# Altium schematic sheet SMPS_Section.SchDoc (part 2 of 2)
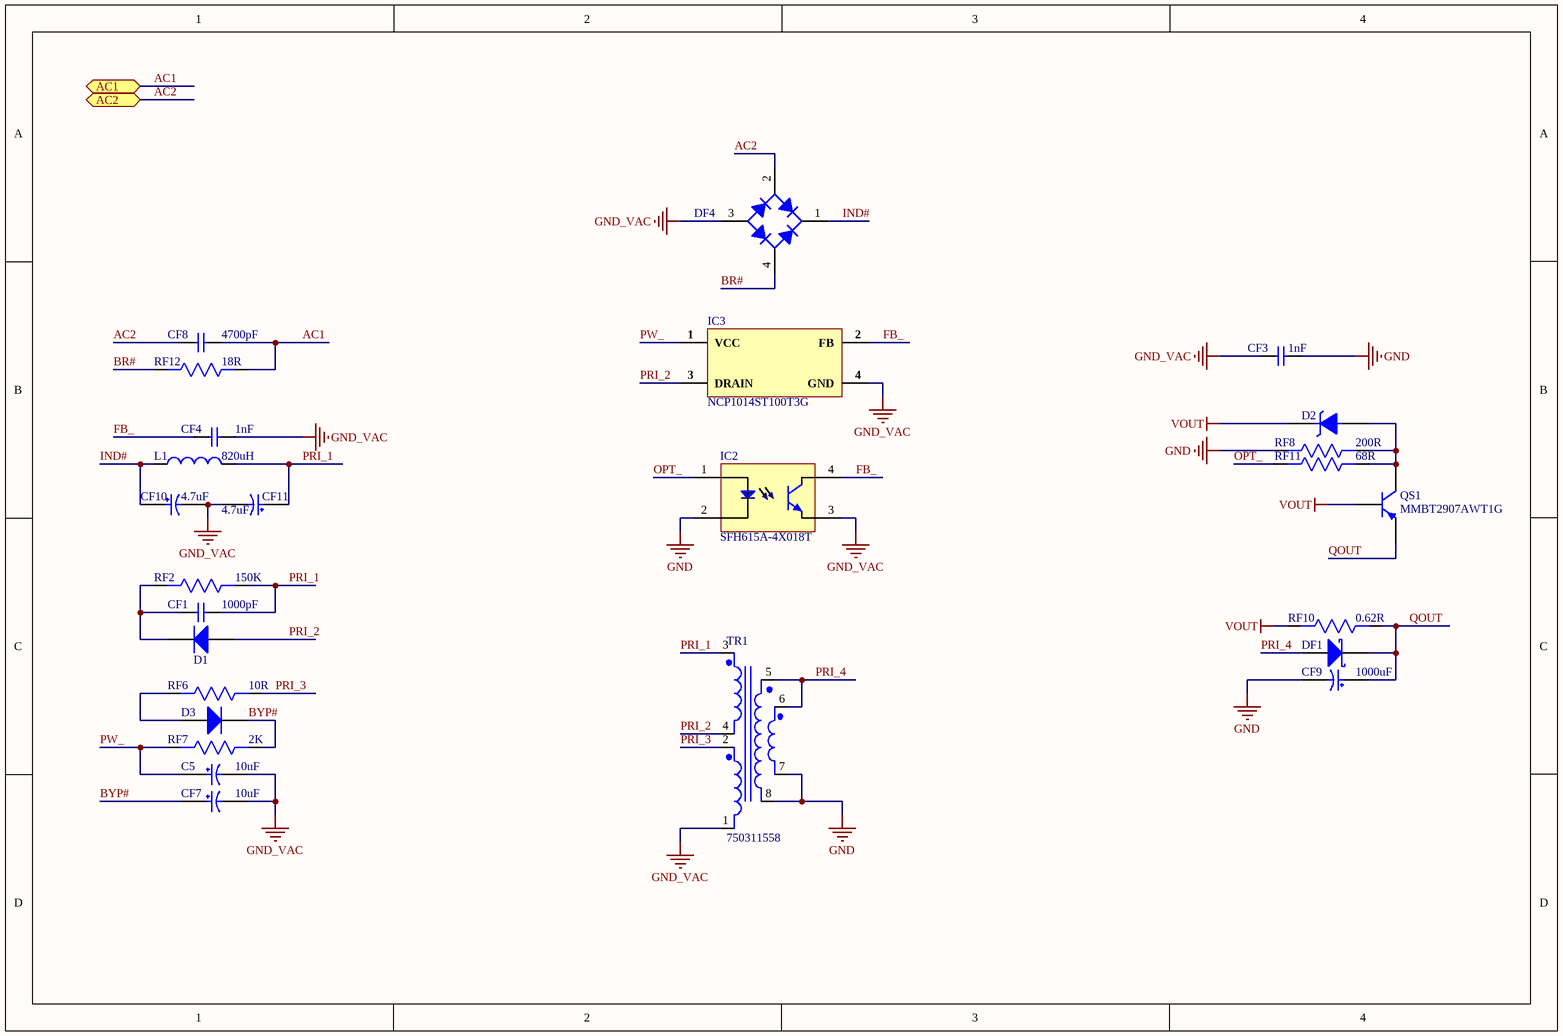
[diagram p1: SMPS_Section.SchDoc]

## Library data of the parts
C5 CF7 = EEE-1EA100WR: CAP ALUM 10UF 20% 25V SMD; Manufacturer: Panasonic; Ripple Current: 22mA; Polarity: Polar; Life (Hours): 2000Hour; Supplier 1: Digi-Key; Manufacturer Part Number: EEE-1EA100WR; RoHS: Yes; Category: Aluminum Electrolytic Capacitors; Stock 1: 20392; Pricing 1: 1=0.29000, 10=0.19700, 50=0.13160, 100=0.11190, 500=0.07896, 1000=0.06909 (USD); Mount: Surface Mount,PCB; Case/Package: Radial; Contact Plating: Tin; Min Operating Temperature: -40°C; Max Operating Temperature: 85°C; Capacitance: 10uF; Tolerance: 20%; Termination: SMD/SMT; Voltage Rating: 25V; Packaging: Tape and Reel; Package Quantity: 1; Voltage Rating (DC): 25V; Ripple Current (AC): 22mA; Diameter: 4mm; Length: 5.5mm; Height: 5.4mm; Height - Seated (Max): 0.213inch; Radiation Hardening: No; Lead Free: Lead Free; REACH SVHC: Unknown; ComponentLink1URL: https://datasheet.ciiva.com/2985/aba0000ce2-2985106.pdf?src-supplier=Avnet; ComponentLink1Description: https://datasheet.ciiva.com/2985/aba0000ce2-2985106.pdf?src-supplier=Avnet; ComponentLink2URL: https://datasheet.ciiva.com/17536/aba0000ce2-17536886.pdf?src-supplier=Avnet+Europe; ComponentLink2Description: https://datasheet.ciiva.com/17536/aba0000ce2-17536886.pdf?src-supplier=Avnet+Europe; ComponentLink3URL: https://datasheet.ciiva.com/16201/aba0000ce2-16201870.pdf?src-supplier=Future+Electronics; ComponentLink3Description: https://datasheet.ciiva.com/16201/aba0000ce2-16201870.pdf?src-supplier=Future+Electronics; Supplier Part Number 1: PCE3895CT-ND
CF1 = C0603W102KDRACAUTO: CAP CER 1000PF 1KV X7R 0603; Manufacturer: KEMET; Supplier 1: Digi-Key; Manufacturer Part Number: C0603W102KDRACAUTO; RoHS: No; Category: Ceramic Capacitors; Stock 1: 2355; Pricing 1: 1=0.49000, 10=0.34600, 50=0.26180, 100=0.22790, 500=0.16884, 1000=0.14351 (USD); Supplier Part Number 1: 399-C0603W102KDRACAUTOCT-ND
CF3 = MPX12W1100FA00MSSD: CAP FILM 1000PF 20% 300VAC RAD; Manufacturer: WIMA; Lead Diameter: 0.6mm; Supplier 1: Digi-Key; Manufacturer Part Number: MPX12W1100FA00MSSD; RoHS: Yes; Category: Uncategorized; Stock 1: 964; Pricing 1: 1=0.74000, 10=0.54300, 100=0.37250, 500=0.29488, 1000=0.24832, 2500=0.23280, 5000=0.21728 (USD); Case/Package: Radial; Min Operating Temperature: -40°C; Max Operating Temperature: 110°C; Capacitance: 1nF; Packaging: Bulk; Tolerance: 20%; Length: 13.5mm; Lead Pitch: 10mm; Depth: 4mm; Radiation Hardening: No; ComponentLink1URL: https://datasheet.ciiva.com/15164/getdatasheetpartid-658504-15164312.pdf?src-supplier=Verical; ComponentLink1Description: https://datasheet.ciiva.com/15164/getdatasheetpartid-658504-15164312.pdf?src-supplier=Verical; Supplier Part Number 1: 1928-1798-ND
CF4 = GRM155R72A102KA01D: CAP CER 1000PF 100V X7R 0402; Manufacturer: Murata; Tolerance: 10%; Supplier 1: Digi-Key; Manufacturer Part Number: GRM155R72A102KA01D; RoHS: Yes; Category: Ceramic Capacitors; Stock 1: 565854; Pricing 1: 1=0.10000, 10=0.04700, 50=0.02540, 100=0.02080, 500=0.01486, 1000=0.01168, 2500=0.01062, 5000=0.00977 (USD); Mount: Surface Mount; Case/Package: 0402; Case Code (Metric): 1005; Case Code (Imperial): 0402; Material: Ceramic; Min Operating Temperature: -55°C; Max Operating Temperature: 125°C; Capacitance: 1nF; Dielectric: X7R; Voltage Rating: 100V; Packaging: Tape and Reel; Package Quantity: 10000; Voltage Rating (DC): 100V; Termination: SMD/SMT; Voltage: 100V; Length: 1mm; Height: 0.5mm; Width: 0.5mm; Thickness: 0.022inch; Depth: 0.5mm; Radiation Hardening: No; REACH SVHC: No SVHC; Lead Free: Lead Free; ComponentLink1URL: https://datasheet.ciiva.com/18184/getdatasheetpartid-223878-18184773.pdf?src-supplier=Verical; ComponentLink1Description: https://datasheet.ciiva.com/18184/getdatasheetpartid-223878-18184773.pdf?src-supplier=Verical; ComponentLink2URL: https://datasheet.ciiva.com/11621/product-11621687.pdf?src-supplier=Avnet; ComponentLink2Description: https://datasheet.ciiva.com/11621/product-11621687.pdf?src-supplier=Avnet; ComponentLink3URL: https://datasheet.ciiva.com/6270/partnumbering-e-01-6270792.pdf?src-supplier=Digi-Key; ComponentLink3Description: https://datasheet.ciiva.com/6270/partnumbering-e-01-6270792.pdf?src-supplier=Digi-Key; ComponentLink4URL: https://datasheet.ciiva.com/6270/partnumbering-e-01-6270796.pdf?src-supplier=Digi-Key; ComponentLink4Description: https://datasheet.ciiva.com/6270/partnumbering-e-01-6270796.pdf?src-supplier=Digi-Key; ComponentLink5URL: https://datasheet.ciiva.com/6270/partnumbering-e-01-6270798.pdf?src-supplier=Digi-Key; ComponentLink5Description: https://datasheet.ciiva.com/6270/partnumbering-e-01-6270798.pdf?src-supplier=Digi-Key; Supplier Part Number 1: 490-6366-1-ND
CF8 = GA355DR7GF472KW01L: CAP CER 4700PF 250VAC X7R 2220; Manufacturer: Murata; Capacitance: 4.7nF; Tolerance: 10%; Voltage Rating: 250V; Supplier 1: Digi-Key; Manufacturer Part Number: GA355DR7GF472KW01L; RoHS: Yes; Category: Ceramic Capacitors; Stock 1: 46734; Pricing 1: 1=1.49000, 10=1.17500, 50=1.01800, 100=0.88090, 500=0.66556 (USD); Mount: Surface Mount; Case/Package: 2220; Number of Pins: 2; Case Code (Imperial): 2220; Case Code (Metric): 5750; Min Operating Temperature: -55°C; Max Operating Temperature: 125°C; Dielectric: X7R; Packaging: Tape and Reel; Package Quantity: 1; Termination: SMD/SMT; Voltage: 250V; Voltage Rating (DC): 250V; Voltage Rating (AC): 250V; Length: 5.7mm; Height: 2mm; Depth: 5mm; Width: 0.197inch; Thickness: 0.079inch; Radiation Hardening: No; REACH SVHC: No SVHC; Lead Free: Lead Free; ComponentLink1URL: https://datasheet.ciiva.com/11787/0900766b80936815-11787945.pdf?src-supplier=RSComponents; ComponentLink1Description: https://datasheet.ciiva.com/11787/0900766b80936815-11787945.pdf?src-supplier=RSComponents; ComponentLink2URL: https://datasheet.ciiva.com/18183/getdatasheetpartid-104333-18183450.pdf?src-supplier=Verical; ComponentLink2Description: https://datasheet.ciiva.com/18183/getdatasheetpartid-104333-18183450.pdf?src-supplier=Verical; ComponentLink3URL: https://datasheet.ciiva.com/142/partnumbering-e-01-142630.pdf?src-supplier=Digi-Key; ComponentLink3Description: https://datasheet.ciiva.com/142/partnumbering-e-01-142630.pdf?src-supplier=Digi-Key; ComponentLink4URL: https://datasheet.ciiva.com/142/partnumbering-e-01-142631.pdf?src-supplier=Digi-Key; ComponentLink4Description: https://datasheet.ciiva.com/142/partnumbering-e-01-142631.pdf?src-supplier=Digi-Key; ComponentLink5URL: https://datasheet.ciiva.com/142/partnumbering-e-01-142632.pdf?src-supplier=Digi-Key; ComponentLink5Description: https://datasheet.ciiva.com/142/partnumbering-e-01-142632.pdf?src-supplier=Digi-Key; ComponentLink6URL: https://datasheet.ciiva.com/22698/1889704-22698361.pdf?src-supplier=Element14; ComponentLink6Description: https://datasheet.ciiva.com/22698/1889704-22698361.pdf?src-supplier=Element14; ComponentLink7URL: https://datasheet.ciiva.com/41649/1506175-41649338.pdf?src-supplier=Farnell; ComponentLink7Description: https://datasheet.ciiva.com/41649/1506175-41649338.pdf?src-supplier=Farnell; ComponentLink8URL: https://datasheet.ciiva.com/7937/c02e-7937503.pdf?src-supplier=Element14; ComponentLink8Description: https://datasheet.ciiva.com/7937/c02e-7937503.pdf?src-supplier=Element14; ComponentLink9URL: https://datasheet.ciiva.com/14104/inga3-14104127.pdf?src-supplier=Distrelec; ComponentLink9Description: https://datasheet.ciiva.com/14104/inga3-14104127.pdf?src-supplier=Distrelec; Supplier Part Number 1: 490-3482-1-ND
CF9 = UWT0J102MNL1GS: CAP ALUM 1000UF 20% 6.3V SMD; Manufacturer: Nichicon; Dielectric Material: Aluminium; Capacitance: 1mF; Ripple Current: 230mA; Dissipation Factor: 0.3%; Leakage Current: 3uA; Life (Hours): 1000Hour; Lead Diameter: 1.1mm; Supplier 1: Digi-Key; Manufacturer Part Number: UWT0J102MNL1GS; RoHS: Yes; Category: Aluminum Electrolytic Capacitors; Stock 1: 46922; Pricing 1: 1=0.45000, 10=0.31900, 50=0.24140, 100=0.21020 (USD); Mount: Surface Mount; Case/Package: Radial; Number of Pins: 2; Min Operating Temperature: -55°C; Max Operating Temperature: 105°C; Tolerance: 20%; Termination: SMD/SMT; Voltage: 6.3V; Voltage Rating: 6.3V; Packaging: Tape and Reel; Ripple Current (AC): 230mA; Package Quantity: 500; Voltage Rating (DC): 6.3V; Features: General Purpose; Diameter: 8mm; Length: 10mm; Height: 10mm; Height - Seated (Max): 0.315inch; Lead Pitch: 3.1mm; Radiation Hardening: No; REACH SVHC: No SVHC; Lead Free: Lead Free; ComponentLink1URL: https://datasheet.ciiva.com/11776/0900766b80fa3a91-11776932.pdf?src-supplier=RSComponents; ComponentLink1Description: https://datasheet.ciiva.com/11776/0900766b80fa3a91-11776932.pdf?src-supplier=RSComponents; ComponentLink2URL: https://datasheet.ciiva.com/112/e-wt-112355.pdf?src-supplier=Digi-Key; ComponentLink2Description: https://datasheet.ciiva.com/112/e-wt-112355.pdf?src-supplier=Digi-Key; ComponentLink3URL: https://datasheet.ciiva.com/112/e-wt-112356.pdf?src-supplier=Digi-Key; ComponentLink3Description: https://datasheet.ciiva.com/112/e-wt-112356.pdf?src-supplier=Digi-Key; ComponentLink4URL: https://datasheet.ciiva.com/112/e-wt-112357.pdf?src-supplier=Digi-Key; ComponentLink4Description: https://datasheet.ciiva.com/112/e-wt-112357.pdf?src-supplier=Digi-Key; ComponentLink5URL: https://datasheet.ciiva.com/16502/e-wt-16502949.pdf?src-supplier=Future+Electronics; ComponentLink5Description: https://datasheet.ciiva.com/16502/e-wt-16502949.pdf?src-supplier=Future+Electronics; ComponentLink6URL: https://datasheet.ciiva.com/28458/1910938-28458373.pdf?src-supplier=Element14; ComponentLink6Description: https://datasheet.ciiva.com/28458/1910938-28458373.pdf?src-supplier=Element14; ComponentLink7URL: https://datasheet.ciiva.com/7793/e-wt-7793495.pdf?src-supplier=Element14; ComponentLink7Description: https://datasheet.ciiva.com/7793/e-wt-7793495.pdf?src-supplier=Element14; Supplier Part Number 1: 493-2160-1-ND
CF10 CF11 = ULR2G4R7MNL1GS: CAP ALUM 4.7UF 20% 400V SMD; Manufacturer: Nichicon; Ripple Current: 35mA; Leakage Current: 100uA; Life (Hours): 3000Hour; Dissipation Factor: 0.25%; Supplier 1: Digi-Key; Manufacturer Part Number: ULR2G4R7MNL1GS; RoHS: Yes; Category: Aluminum Electrolytic Capacitors; Stock 1: 108237; Pricing 1: 1=0.77000, 10=0.56900, 50=0.45540, 100=0.39030 (USD); Mount: Surface Mount; Case/Package: SMD/SMT; Min Operating Temperature: -40°C; Max Operating Temperature: 105°C; Voltage Rating (DC): 400V; Tolerance: 20%; Capacitance: 4.7uF; Packaging: Tape and Reel; Package Quantity: 500; Termination: SMD/SMT; Voltage Rating: 400V; Voltage: 400V; Diameter: 10mm; Length: 10mm; Height: 10mm; Height - Seated (Max): 0.433inch; Lead Pitch: 4.5mm; Lead Free: Lead Free; ComponentLink1URL: https://datasheet.ciiva.com/6317/e-lr-6317191.pdf?src-supplier=Digi-Key; ComponentLink1Description: https://datasheet.ciiva.com/6317/e-lr-6317191.pdf?src-supplier=Digi-Key; ComponentLink2URL: https://datasheet.ciiva.com/6317/e-lr-6317193.pdf?src-supplier=Digi-Key; ComponentLink2Description: https://datasheet.ciiva.com/6317/e-lr-6317193.pdf?src-supplier=Digi-Key; Supplier Part Number 1: 493-6709-1-ND
D1 = MURS160T3G: DIODE GEN PURP 600V 2A SMB; Manufacturer: ON Semiconductor; Max Surge Current: 35A; Recovery Time: 75ns; Forward Voltage: 1.25V; Max Reverse Current: 5uA; Average Rectified Current: 1A; Element Configuration: Single; Polarity: Standard; Supplier 1: Digi-Key; Manufacturer Part Number: MURS160T3G; RoHS: Yes; Category: Rectifier Diodes; Stock 1: 315219; Pricing 1: 1=0.41000, 10=0.27700, 100=0.16350, 500=0.11066, 1000=0.08803 (USD); Case/Package: SMB; Number of Pins: 2; Contact Plating: Tin,Matte; Min Operating Temperature: -65°C; Max Operating Temperature: 175°C; Package Quantity: 2500; Forward Current: 2A; Packaging: Tape and Reel; Reverse Recovery Time: 75ns; Max Repetitive Reverse Voltage (Vrrm): 600V; Max Forward Surge Current (Ifsm): 35A; Termination: SMD/SMT; Peak Non-Repetitive Surge Current: 35A; Voltage Rating (DC): 600V; Current Rating: 1A; Output Current: 1A; Max Reverse Voltage (DC): 600V; Reverse Voltage: 600V; Length: 4.32mm; Height: 2.13mm; Width: 3.56mm; Radiation Hardening: No; REACH SVHC: No SVHC; Lead Free: Lead Free; Halogen Free: Halogen Free; ComponentLink1URL: https://datasheet.ciiva.com/14169/tw601232-14169051.pdf?src-supplier=Distrelec; ComponentLink1Description: https://datasheet.ciiva.com/14169/tw601232-14169051.pdf?src-supplier=Distrelec; ComponentLink2URL: https://datasheet.ciiva.com/16470/murs120t3-d-16470453.pdf?src-supplier=Future+Electronics; ComponentLink2Description: https://datasheet.ciiva.com/16470/murs120t3-d-16470453.pdf?src-supplier=Future+Electronics; ComponentLink3URL: https://datasheet.ciiva.com/5763/murs120t3-d-5763111.pdf?src-supplier=Farnell; ComponentLink3Description: https://datasheet.ciiva.com/5763/murs120t3-d-5763111.pdf?src-supplier=Farnell; ComponentLink4URL: https://datasheet.ciiva.com/16474/murs120t3-d-16474392.pdf?src-supplier=Avnet+Asia; ComponentLink4Description: https://datasheet.ciiva.com/16474/murs120t3-d-16474392.pdf?src-supplier=Avnet+Asia; ComponentLink5URL: https://datasheet.ciiva.com/8294/murs120t3-d-8294553.pdf?src-supplier=Avnet; ComponentLink5Description: https://datasheet.ciiva.com/8294/murs120t3-d-8294553.pdf?src-supplier=Avnet; ComponentLink6URL: https://datasheet.ciiva.com/25950/murs120t3-d-25950042.pdf?src-supplier=Avnet+Europe; ComponentLink6Description: https://datasheet.ciiva.com/25950/murs120t3-d-25950042.pdf?src-supplier=Avnet+Europe; ComponentLink7URL: https://datasheet.ciiva.com/7962/murs120t3-d-7962876.pdf?src-supplier=Element14; ComponentLink7Description: https://datasheet.ciiva.com/7962/murs120t3-d-7962876.pdf?src-supplier=Element14; ComponentLink8URL: https://datasheet.ciiva.com/7962/murs120t3-d-7962877.pdf?src-supplier=Element14; ComponentLink8Description: https://datasheet.ciiva.com/7962/murs120t3-d-7962877.pdf?src-supplier=Element14; ComponentLink9URL: https://datasheet.ciiva.com/7962/murs120t3-d-7962878.pdf?src-supplier=Element14; ComponentLink9Description: https://datasheet.ciiva.com/7962/murs120t3-d-7962878.pdf?src-supplier=Element14; Supplier Part Number 1: MURS160T3GOSCT-ND
D2 = MMSZ5229BT1: DIODE ZENER 4.3V 500MW SOD123; Manufacturer: ON Semiconductor; Manufacturer Part Number: MMSZ5229BT1G; Material: Plastic; Tolerance: 5%; Impedance: 22R; Max Reverse Leakage Current: 5uA; Zener Current: 10mA; Test Current: 20mA; Element Configuration: Single; Forward Voltage: 900mV; ESD Protection: Yes; Supplier 1: Digi-Key; RoHS: Yes; Category: Zener Diodes; Stock 1: 9037; Pricing 1: 1=0.21000, 10=0.18400, 100=0.08670, 500=0.05146, 1000=0.03381 (USD); Case/Package: SOD-123-2; Number of Pins: 2; Contact Plating: Tin,Matte; Min Operating Temperature: -55°C; Max Operating Temperature: 150°C; Packaging: Tape and Reel; Max Power Dissipation: 500mW; Package Quantity: 1; Zener Voltage: 4.3V; Voltage Tolerance: 5%; Power Dissipation: 500mW; Voltage Rating (DC): 4.3V; Power Rating: 500mW; Working Voltage: 4.3V; Max Reverse Current: 5uA; Termination: SMD/SMT; Length: 2.69mm; Height: 1.12mm; Width: 1.6mm; Radiation Hardening: No; Lead Free: Lead Free; REACH SVHC: No SVHC; ComponentLink1URL: https://datasheet.ciiva.com/15142/getdatasheetpartid-88753-15142539.pdf?src-supplier=Verical; ComponentLink1Description: https://datasheet.ciiva.com/15142/getdatasheetpartid-88753-15142539.pdf?src-supplier=Verical; ComponentLink2URL: https://datasheet.ciiva.com/894/mmsz5221bt1-d-894935.pdf?src-supplier=Digi-Key; ComponentLink2Description: https://datasheet.ciiva.com/894/mmsz5221bt1-d-894935.pdf?src-supplier=Digi-Key; ComponentLink3URL: https://datasheet.ciiva.com/4731/mmsz5221bt1-d-4731591.pdf?src-supplier=Mouser; ComponentLink3Description: https://datasheet.ciiva.com/4731/mmsz5221bt1-d-4731591.pdf?src-supplier=Mouser; ComponentLink4URL: https://datasheet.ciiva.com/26093/mmsz5221bt1-d-26093031.pdf?src-supplier=Avnet+Europe; ComponentLink4Description: https://datasheet.ciiva.com/26093/mmsz5221bt1-d-26093031.pdf?src-supplier=Avnet+Europe; ComponentLink5URL: https://datasheet.ciiva.com/894/mmsz5221bt1-d-894936.pdf?src-supplier=Digi-Key; ComponentLink5Description: https://datasheet.ciiva.com/894/mmsz5221bt1-d-894936.pdf?src-supplier=Digi-Key; ComponentLink6URL: https://datasheet.ciiva.com/8346/mmsz5221bt1-d-8346200.pdf?src-supplier=Avnet; ComponentLink6Description: https://datasheet.ciiva.com/8346/mmsz5221bt1-d-8346200.pdf?src-supplier=Avnet; ComponentLink7URL: https://datasheet.ciiva.com/894/mmsz5221bt1-d-894937.pdf?src-supplier=Digi-Key; ComponentLink7Description: https://datasheet.ciiva.com/894/mmsz5221bt1-d-894937.pdf?src-supplier=Digi-Key; ComponentLink8URL: https://datasheet.ciiva.com/8348/mmsz5221bt1-d-8348107.pdf?src-supplier=Avnet; ComponentLink8Description: https://datasheet.ciiva.com/8348/mmsz5221bt1-d-8348107.pdf?src-supplier=Avnet; ComponentLink9URL: https://datasheet.ciiva.com/16463/mmsz5221bt1-d-16463245.pdf?src-supplier=Future+Electronics; ComponentLink9Description: https://datasheet.ciiva.com/16463/mmsz5221bt1-d-16463245.pdf?src-supplier=Future+Electronics; ComponentLink10URL: https://datasheet.ciiva.com/16473/mmsz5221bt1-d-16473405.pdf?src-supplier=Avnet+Asia; ComponentLink10Description: https://datasheet.ciiva.com/16473/mmsz5221bt1-d-16473405.pdf?src-supplier=Avnet+Asia; ComponentLink11URL: https://datasheet.ciiva.com/22697/86126-22697917.pdf?src-supplier=Element14; ComponentLink11Description: https://datasheet.ciiva.com/22697/86126-22697917.pdf?src-supplier=Element14; ComponentLink12URL: https://datasheet.ciiva.com/8026/86126-8026846.pdf?src-supplier=Element14; ComponentLink12Description: https://datasheet.ciiva.com/8026/86126-8026846.pdf?src-supplier=Element14; Supplier Part Number 1: MMSZ5229BT1GOSCT-ND
D3 = MMSD4148T1G: DIODE GEN PURP 100V 200MA SOD123; Manufacturer: ON Semiconductor; Reverse Recovery Time: 4ns; Peak Non-Repetitive Surge Current: 2A; Element Configuration: Single; Forward Voltage: 1V; Max Reverse Current: 5uA; Power Dissipation: 425mW; Polarity: Standard; Current Rating: 200A; Capacitance: 4pF; Supplier 1: Digi-Key; Manufacturer Part Number: MMSD4148T1G; RoHS: Yes; Category: Rectifier Diodes; Stock 1: 208512; Pricing 1: 1=0.13000, 10=0.11100, 100=0.04270, 500=0.03116, 1000=0.02092 (USD); Case/Package: SOD-123-2; Number of Pins: 2; Contact Plating: Tin,Matte; Min Operating Temperature: -55°C; Max Operating Temperature: 150°C; Forward Current: 200mA; Max Repetitive Reverse Voltage (Vrrm): 100V; Recovery Time: 4ns; Max Surge Current: 2A; Package Quantity: 1; Packaging: Tape and Reel; Average Rectified Current: 200mA; Max Reverse Voltage (DC): 100V; Max Reverse Leakage Current: 5uA; Max Forward Surge Current (Ifsm): 2A; Voltage Rating (DC): 100V; Output Current: 200mA; Length: 2.69mm; Height: 1.12mm; Width: 1.6mm; Radiation Hardening: No; Lead Free: Lead Free; Halogen Free: Halogen Free; REACH SVHC: No SVHC; ComponentLink1URL: https://datasheet.ciiva.com/22663/1707241-22663688.pdf?src-supplier=Element14; ComponentLink1Description: https://datasheet.ciiva.com/22663/1707241-22663688.pdf?src-supplier=Element14; ComponentLink2URL: https://datasheet.ciiva.com/8294/mmsd4148t1-d-8294902.pdf?src-supplier=Avnet; ComponentLink2Description: https://datasheet.ciiva.com/8294/mmsd4148t1-d-8294902.pdf?src-supplier=Avnet; ComponentLink3URL: https://datasheet.ciiva.com/915/mmsd4148t1-d-915383.pdf?src-supplier=Digi-Key; ComponentLink3Description: https://datasheet.ciiva.com/915/mmsd4148t1-d-915383.pdf?src-supplier=Digi-Key; ComponentLink4URL: https://datasheet.ciiva.com/16474/mmsd4148t1-d-16474311.pdf?src-supplier=Avnet+Asia; ComponentLink4Description: https://datasheet.ciiva.com/16474/mmsd4148t1-d-16474311.pdf?src-supplier=Avnet+Asia; ComponentLink5URL: https://datasheet.ciiva.com/915/mmsd4148t1-d-915384.pdf?src-supplier=Digi-Key; ComponentLink5Description: https://datasheet.ciiva.com/915/mmsd4148t1-d-915384.pdf?src-supplier=Digi-Key; ComponentLink6URL: https://datasheet.ciiva.com/915/mmsd4148t1-d-915385.pdf?src-supplier=Digi-Key; ComponentLink6Description: https://datasheet.ciiva.com/915/mmsd4148t1-d-915385.pdf?src-supplier=Digi-Key; ComponentLink7URL: https://datasheet.ciiva.com/16368/mmsd4148t1-d-16368570.pdf?src-supplier=Future+Electronics; ComponentLink7Description: https://datasheet.ciiva.com/16368/mmsd4148t1-d-16368570.pdf?src-supplier=Future+Electronics; ComponentLink8URL: https://datasheet.ciiva.com/8299/mmsd4148t1-d-8299883.pdf?src-supplier=Avnet; ComponentLink8Description: https://datasheet.ciiva.com/8299/mmsd4148t1-d-8299883.pdf?src-supplier=Avnet; ComponentLink9URL: https://datasheet.ciiva.com/25947/mmsd4148t1-d-25947947.pdf?src-supplier=Avnet+Europe; ComponentLink9Description: https://datasheet.ciiva.com/25947/mmsd4148t1-d-25947947.pdf?src-supplier=Avnet+Europe; ComponentLink10URL: https://datasheet.ciiva.com/8053/mmsd4148t1-d-8053692.pdf?src-supplier=Element14; ComponentLink10Description: https://datasheet.ciiva.com/8053/mmsd4148t1-d-8053692.pdf?src-supplier=Element14; ComponentLink11URL: https://datasheet.ciiva.com/8053/mmsd4148t1-d-8053693.pdf?src-supplier=Element14; ComponentLink11Description: https://datasheet.ciiva.com/8053/mmsd4148t1-d-8053693.pdf?src-supplier=Element14; ComponentLink12URL: https://datasheet.ciiva.com/15144/getdatasheetpartid-78734-15144509.pdf?src-supplier=Verical; ComponentLink12Description: https://datasheet.ciiva.com/15144/getdatasheetpartid-78734-15144509.pdf?src-supplier=Verical; Supplier Part Number 1: MMSD4148T1GOSCT-ND
DF1 = MBRS360T3G: DIODE SCHOTTKY 60V 3A SMC; Manufacturer: ON Semiconductor; Max Reverse Current: 150uA; Peak Non-Repetitive Surge Current: 125A; Element Configuration: Single; Forward Voltage: 740mV; Polarity: Standard; Supplier 1: Digi-Key; Manufacturer Part Number: MBRS360T3G; RoHS: Yes; Category: Schottky Diodes; Stock 1: 113534; Pricing 1: 1=0.47000, 10=0.34700, 100=0.24180, 500=0.15314, 1000=0.12493 (USD); Case/Package: SMC; Number of Pins: 2; Contact Plating: Tin,Matte; Min Operating Temperature: -65°C; Max Operating Temperature: 175°C; Forward Current: 3A; Max Repetitive Reverse Voltage (Vrrm): 60V; Package Quantity: 2500; Max Surge Current: 125A; Packaging: Tape and Reel; Max Reverse Leakage Current: 150uA; Average Rectified Current: 3A; Max Forward Surge Current (Ifsm): 125A; Termination: SMD/SMT; Voltage Rating (DC): 60V; Current Rating: 3A; Output Current: 3A; Max Reverse Voltage (DC): 60V; Length: 6.86mm; Height: 2.13mm; Width: 5.84mm; Radiation Hardening: No; REACH SVHC: No SVHC; Lead Free: Lead Free; Halogen Free: Halogen Free; ComponentLink1URL: https://datasheet.ciiva.com/34301/866314-34301618.pdf?src-supplier=Jameco; ComponentLink1Description: https://datasheet.ciiva.com/34301/866314-34301618.pdf?src-supplier=Jameco; ComponentLink2URL: https://datasheet.ciiva.com/25954/mbrs360t3-d-25954259.pdf?src-supplier=Avnet+Europe; ComponentLink2Description: https://datasheet.ciiva.com/25954/mbrs360t3-d-25954259.pdf?src-supplier=Avnet+Europe; ComponentLink3URL: https://datasheet.ciiva.com/26788/mbrs360t3g-26788572.pdf?src-supplier=IIIC; ComponentLink3Description: https://datasheet.ciiva.com/26788/mbrs360t3g-26788572.pdf?src-supplier=IIIC; ComponentLink4URL: https://datasheet.ciiva.com/916/mbrs360t3-d-916052.pdf?src-supplier=Digi-Key; ComponentLink4Description: https://datasheet.ciiva.com/916/mbrs360t3-d-916052.pdf?src-supplier=Digi-Key; ComponentLink5URL: https://datasheet.ciiva.com/916/mbrs360t3-d-916053.pdf?src-supplier=Digi-Key; ComponentLink5Description: https://datasheet.ciiva.com/916/mbrs360t3-d-916053.pdf?src-supplier=Digi-Key; ComponentLink6URL: https://datasheet.ciiva.com/916/mbrs360t3-d-916054.pdf?src-supplier=Digi-Key; ComponentLink6Description: https://datasheet.ciiva.com/916/mbrs360t3-d-916054.pdf?src-supplier=Digi-Key; ComponentLink7URL: https://datasheet.ciiva.com/8299/mbrs360t3-d-8299863.pdf?src-supplier=Avnet; ComponentLink7Description: https://datasheet.ciiva.com/8299/mbrs360t3-d-8299863.pdf?src-supplier=Avnet; ComponentLink8URL: https://datasheet.ciiva.com/28655/mbrs360t3-d-28655799.pdf?src-supplier=Element14; ComponentLink8Description: https://datasheet.ciiva.com/28655/mbrs360t3-d-28655799.pdf?src-supplier=Element14; ComponentLink9URL: https://datasheet.ciiva.com/22659/1806490-22659080.pdf?src-supplier=Element14; ComponentLink9Description: https://datasheet.ciiva.com/22659/1806490-22659080.pdf?src-supplier=Element14; ComponentLink10URL: https://datasheet.ciiva.com/5763/mbrs360t3-d-5763035.pdf?src-supplier=Farnell; ComponentLink10Description: https://datasheet.ciiva.com/5763/mbrs360t3-d-5763035.pdf?src-supplier=Farnell; ComponentLink11URL: https://datasheet.ciiva.com/8294/mbrs360t3-d-8294987.pdf?src-supplier=Avnet; ComponentLink11Description: https://datasheet.ciiva.com/8294/mbrs360t3-d-8294987.pdf?src-supplier=Avnet; ComponentLink12URL: https://datasheet.ciiva.com/16475/mbrs360t3-d-16475163.pdf?src-supplier=Avnet+Asia; ComponentLink12Description: https://datasheet.ciiva.com/16475/mbrs360t3-d-16475163.pdf?src-supplier=Avnet+Asia; ComponentLink13URL: https://datasheet.ciiva.com/7962/mbrs360t3-d-7962828.pdf?src-supplier=Element14; ComponentLink13Description: https://datasheet.ciiva.com/7962/mbrs360t3-d-7962828.pdf?src-supplier=Element14; ComponentLink14URL: https://datasheet.ciiva.com/7962/mbrs360t3-d-7962829.pdf?src-supplier=Element14; ComponentLink14Description: https://datasheet.ciiva.com/7962/mbrs360t3-d-7962829.pdf?src-supplier=Element14; ComponentLink15URL: https://datasheet.ciiva.com/7962/mbrs360t3-d-7962830.pdf?src-supplier=Element14; ComponentLink15Description: https://datasheet.ciiva.com/7962/mbrs360t3-d-7962830.pdf?src-supplier=Element14; Supplier Part Number 1: MBRS360T3GOSCT-ND
DF4 = DF04S-T: RECT BRIDGE GPP 1A 400V DFS; Manufacturer: Diodes; Element Configuration: Single; Max Reverse Current: 10uA; Forward Voltage: 1.1V; Max Surge Current: 50A; Number of Elements: 1; Reverse Voltage (DC): 280V; Supplier 1: Newark; Manufacturer Part Number: DF04S-T; RoHS: Yes; Category: Rectifier Diodes; Mount: Surface Mount; Case/Package: SMD/SMT; Number of Pins: 4; Weight: 0.010547oz; Min Operating Temperature: -65°C; Max Operating Temperature: 150°C; Packaging: Tape and Reel; Package Quantity: 1; Max Repetitive Reverse Voltage (Vrrm): 400V; Termination: SMD/SMT; Forward Current: 1A; Peak Non-Repetitive Surge Current: 50A; Max Forward Surge Current (Ifsm): 50A; Average Rectified Current: 1A; Length: 8.51mm; Height: 3.4mm; Width: 6.5mm; Radiation Hardening: No; Lead Free: Lead Free; ComponentLink1URL: https://datasheet.ciiva.com/34302/1540050-34302383.pdf?src-supplier=Jameco; ComponentLink1Description: https://datasheet.ciiva.com/34302/1540050-34302383.pdf?src-supplier=Jameco; ComponentLink2URL: https://datasheet.ciiva.com/26788/df04s-t-26788074.pdf?src-supplier=IIIC; ComponentLink2Description: https://datasheet.ciiva.com/26788/df04s-t-26788074.pdf?src-supplier=IIIC; ComponentLink3URL: https://datasheet.ciiva.com/25958/ds17001-25958714.pdf?src-supplier=Avnet+Europe; ComponentLink3Description: https://datasheet.ciiva.com/25958/ds17001-25958714.pdf?src-supplier=Avnet+Europe; ComponentLink4URL: https://datasheet.ciiva.com/11195/ds17001-11195727.pdf?src-supplier=Avnet; ComponentLink4Description: https://datasheet.ciiva.com/11195/ds17001-11195727.pdf?src-supplier=Avnet; Supplier Part Number 1: 60AC8755
IC2 = SFH615A-4X018T: OPTOISOLATOR 5.3KV TRANS 4SMD; Manufacturer: Vishay; Max Power Dissipation: 150mW; Number of Channels: 1; Collector Emitter Voltage (VCEO): 70V; Rise Time: 4us; Max Collector Current: 100mA; Collector Emitter Saturation Voltage: 400mV; Max Input Current: 60mA; Fall Time: 15us; Reverse Breakdown Voltage: 6V; Forward Voltage: 1.65V; Output Current per Channel: 50mA; Current Transfer Ratio: 320%; Supplier 1: Digi-Key; Manufacturer Part Number: SFH615A-4X018T; RoHS: Yes; Category: Optocouplers; Stock 1: 1486; Pricing 1: 1=1.06000, 10=0.82300, 100=0.52880, 500=0.44650, 1000=0.35250 (USD); Mount: Surface Mount; Case/Package: SMD/SMT; Number of Pins: 4; Min Operating Temperature: -55°C; Max Operating Temperature: 100°C; Packaging: Tape and Reel; Isolation Voltage: 5.3kV; Forward Current: 60mA; Package Quantity: 2000; Max Output Voltage: 70V; Number of Elements: 1; Power Dissipation: 150mW; Radiation Hardening: No; Supplier Part Number 1: SFH615A-4X018TCT-ND
IC3 = NCP1014ST100T3G: IC CTLR/MOSFET 100KHZ SOT223; Manufacturer: ON Semiconductor; Power Rating: 19W; Max Input Voltage: 250V; Min Input Voltage: 100V; Max Supply Voltage: 10V; Max Output Current: 450mA; Max Duty Cycle: 72%; Breakdown Voltage: 700V; Topology: Flyback; Supplier 1: Digi-Key; Manufacturer Part Number: NCP1014ST100T3G; RoHS: Yes; Category: Power Products; Stock 1: 17305; Pricing 1: 1=1.09000, 10=0.97200, 25=0.92280, 100=0.70840, 250=0.62604, 500=0.59310, 1000=0.46130 (USD); Case/Package: SOT-223-4; Number of Pins: 4; Min Operating Temperature: -40°C; Max Operating Temperature: 125°C; Package Quantity: 1; Switching Frequency: 100kHz; Packaging: Tape and Reel; Output Current: 450mA; Min Input Voltage (AC): 100V; Max Input Voltage (AC): 250V; Duty Cycle: 72%; Max Power Dissipation: 19W; Length: 6.7mm; Height: 1.65mm; Width: 3.7mm; Radiation Hardening: No; REACH SVHC: No SVHC; Lead Free: Lead Free; Halogen Free: Halogen Free; ComponentLink1URL: https://datasheet.ciiva.com/1930/ncp1010-d-1930949.pdf?src-supplier=Digi-Key; ComponentLink1Description: https://datasheet.ciiva.com/1930/ncp1010-d-1930949.pdf?src-supplier=Digi-Key; ComponentLink2URL: https://datasheet.ciiva.com/1930/ncp1010-d-1930950.pdf?src-supplier=Digi-Key; ComponentLink2Description: https://datasheet.ciiva.com/1930/ncp1010-d-1930950.pdf?src-supplier=Digi-Key; ComponentLink3URL: https://datasheet.ciiva.com/8197/ncp1010-d-8197482.pdf?src-supplier=Avnet; ComponentLink3Description: https://datasheet.ciiva.com/8197/ncp1010-d-8197482.pdf?src-supplier=Avnet; ComponentLink4URL: https://datasheet.ciiva.com/26081/ncp1010-d-26081498.pdf?src-supplier=Avnet+Europe; ComponentLink4Description: https://datasheet.ciiva.com/26081/ncp1010-d-26081498.pdf?src-supplier=Avnet+Europe; ComponentLink5URL: https://datasheet.ciiva.com/16469/ncp1010-d-16469819.pdf?src-supplier=Future+Electronics; ComponentLink5Description: https://datasheet.ciiva.com/16469/ncp1010-d-16469819.pdf?src-supplier=Future+Electronics; ComponentLink6URL: https://datasheet.ciiva.com/22628/1712830-22628780.pdf?src-supplier=Element14; ComponentLink6Description: https://datasheet.ciiva.com/22628/1712830-22628780.pdf?src-supplier=Element14; Supplier Part Number 1: NCP1014ST100T3GOSCT-ND
L1 = DR74-821-R: Inductor shielded 820uH 0.35A SMD; Manufacturer: Eaton Cooper; Core Material: Ferrite; Tolerance: 20%; Max DC Current: 310mA; Saturation Current: 350mA; DC Resistance (DCR): 2.93R; Test Frequency: 100kHz; Supplier 1: Digi-Key; Manufacturer Part Number: DR74-821-R; RoHS: Yes; Category: Fixed Inductors; Stock 1: 498; Pricing 1: 1=0.89000, 10=0.82900, 25=0.76520, 50=0.63760, 100=0.59930, 250=0.53552, 500=0.45900 (USD); Mount: Surface Mount; Case/Package: Nonstandard; Number of Pins: 2; Weight: 0.048oz; Min Operating Temperature: -40°C; Max Operating Temperature: 125°C; Inductance: 820uH; Packaging: Tape and Reel; Shielding: Shielded; Package Quantity: 1100; Current Rating: 310mA; Inductance Tolerance: 20%; Resistor Type: Wirewound; Termination: SMD/SMT; DC Current: 310mA; Self Resonant Frequency: 100kHz; RMS Current (Irms): 310mA; Length: 7.6mm; Height: 4.35mm; Width: 0.299inch; Height - Seated (Max): 0.171inch; Depth: 7.6mm; Radiation Hardening: No; REACH SVHC: No SVHC; Lead Free: Lead Free; Military Standard: Not; ComponentLink1URL: https://datasheet.ciiva.com/14667/0900766b8116a153-14667792.pdf?src-supplier=RSComponents; ComponentLink1Description: https://datasheet.ciiva.com/14667/0900766b8116a153-14667792.pdf?src-supplier=RSComponents; ComponentLink2URL: https://datasheet.ciiva.com/26858/getdatasheetpartid-571272-26858465.pdf?src-supplier=Verical; ComponentLink2Description: https://datasheet.ciiva.com/26858/getdatasheetpartid-571272-26858465.pdf?src-supplier=Verical; ComponentLink3URL: https://datasheet.ciiva.com/30139/43bus-elx-ds-4315-dr-ser-30139975.pdf?src-supplier=Onlinecomponents.com; ComponentLink3Description: https://datasheet.ciiva.com/30139/43bus-elx-ds-4315-dr-ser-30139975.pdf?src-supplier=Onlinecomponents.com; ComponentLink4URL: https://datasheet.ciiva.com/16378/4a32919a-7470-4ae0-be45-b59e3a1351ef-16378457.pdf?src-supplier=Future+Electronics; ComponentLink4Description: https://datasheet.ciiva.com/16378/4a32919a-7470-4ae0-be45-b59e3a1351ef-16378457.pdf?src-supplier=Future+Electronics; ComponentLink5URL: https://datasheet.ciiva.com/4957/bus-elx-ds-4315-dr-series-4957657.pdf?src-supplier=Mouser; ComponentLink5Description: https://datasheet.ciiva.com/4957/bus-elx-ds-4315-dr-series-4957657.pdf?src-supplier=Mouser; ComponentLink6URL: https://datasheet.ciiva.com/8005/87246-8005245.pdf?src-supplier=Element14; ComponentLink6Description: https://datasheet.ciiva.com/8005/87246-8005245.pdf?src-supplier=Element14; ComponentLink7URL: https://datasheet.ciiva.com/48955/70037876-48955567.pdf?src-supplier=Allied+Electronics; ComponentLink7Description: https://datasheet.ciiva.com/48955/70037876-48955567.pdf?src-supplier=Allied+Electronics; Supplier Part Number 1: 513-1667-1-ND
QS1 = MMBT2907AWT1G: TRANS PNP 60V 0.6A SOT323; Manufacturer: ON Semiconductor; Max Power Dissipation: 150mW; Frequency: 200MHz; hFE Min: 75; Max Collector Current: 600mA; Emitter Base Voltage (VEBO): 5V; Collector Emitter Saturation Voltage: -1.6V; Number of Elements: 1; Element Configuration: Single; Voltage Rating (DC): -60V; Current Rating: -600mA; Supplier 1: Digi-Key; Manufacturer Part Number: MMBT2907AWT1G; RoHS: Yes; Category: BJTs; Stock 1: 32992; Pricing 1: 1=0.15000, 10=0.14000, 25=0.13360, 100=0.05890, 500=0.04622, 1000=0.03210 (USD); Case/Package: SC; Number of Pins: 3; Contact Plating: Tin,Matte; Min Operating Temperature: -55°C; Max Operating Temperature: 150°C; Package Quantity: 1; Collector Emitter Voltage (VCEO): 60V; Packaging: Tape and Reel; Transition Frequency: 200MHz; Collector Emitter Breakdown Voltage: 60V; Polarity: PNP; Collector Base Voltage (VCBO): 60V; Power Dissipation: 150mW; Gain Bandwidth Product: 200MHz; Max Breakdown Voltage: 60V; Max Frequency: 200MHz; Length: 2.2mm; Height: 0.7mm; Width: 1.35mm; Radiation Hardening: No; Lead Free: Lead Free; REACH SVHC: No SVHC; ComponentLink1URL: https://datasheet.ciiva.com/15139/getdatasheetpartid-82693-15139079.pdf?src-supplier=Verical; ComponentLink1Description: https://datasheet.ciiva.com/15139/getdatasheetpartid-82693-15139079.pdf?src-supplier=Verical; ComponentLink2URL: https://datasheet.ciiva.com/4721/mmbt2907awt1-d-113164-4721597.pdf?src-supplier=Mouser; ComponentLink2Description: https://datasheet.ciiva.com/4721/mmbt2907awt1-d-113164-4721597.pdf?src-supplier=Mouser; ComponentLink3URL: https://datasheet.ciiva.com/976/mmbt2907awt1-d-976459.pdf?src-supplier=Digi-Key; ComponentLink3Description: https://datasheet.ciiva.com/976/mmbt2907awt1-d-976459.pdf?src-supplier=Digi-Key; ComponentLink4URL: https://datasheet.ciiva.com/7972/1708266-7972379.pdf?src-supplier=Element14; ComponentLink4Description: https://datasheet.ciiva.com/7972/1708266-7972379.pdf?src-supplier=Element14; ComponentLink5URL: https://datasheet.ciiva.com/11201/mmbt2907awt1-d-11201771.pdf?src-supplier=Avnet; ComponentLink5Description: https://datasheet.ciiva.com/11201/mmbt2907awt1-d-11201771.pdf?src-supplier=Avnet; ComponentLink6URL: https://datasheet.ciiva.com/26115/mmbt2907awt1-d-26115115.pdf?src-supplier=Avnet+Europe; ComponentLink6Description: https://datasheet.ciiva.com/26115/mmbt2907awt1-d-26115115.pdf?src-supplier=Avnet+Europe; ComponentLink7URL: https://datasheet.ciiva.com/976/mmbt2907awt1-d-976460.pdf?src-supplier=Digi-Key; ComponentLink7Description: https://datasheet.ciiva.com/976/mmbt2907awt1-d-976460.pdf?src-supplier=Digi-Key; ComponentLink8URL: https://datasheet.ciiva.com/7972/1708266-7972380.pdf?src-supplier=Element14; ComponentLink8Description: https://datasheet.ciiva.com/7972/1708266-7972380.pdf?src-supplier=Element14; ComponentLink9URL: https://datasheet.ciiva.com/22664/1708266-22664157.pdf?src-supplier=Element14; ComponentLink9Description: https://datasheet.ciiva.com/22664/1708266-22664157.pdf?src-supplier=Element14; ComponentLink10URL: https://datasheet.ciiva.com/22664/1708266-22664158.pdf?src-supplier=Element14; ComponentLink10Description: https://datasheet.ciiva.com/22664/1708266-22664158.pdf?src-supplier=Element14; Supplier Part Number 1: MMBT2907AWT1GOSCT-ND
RF2 = ERJ-PA3J154V: Res Thick Film 0603 150K Ohm 5% 0.25W(1/4W) ±200ppm/C Pad SMD Automotive T/R; Manufacturer: Panasonic; Resistance: 150kR; Max Power Dissipation: 250mW; Temperature Coefficient: 200ppm/°C; Supplier 1: Digi-Key; Manufacturer Part Number: ERJ-PA3J154V; RoHS: Yes; Category: Chip SMD Resistors; Stock 1: 21971; Pricing 1: 1=0.10000, 10=0.07800, 100=0.03000, 1000=0.01320, 2500=0.01140 (USD); Case/Package: 0603; Case Code (Imperial): 0603; Case Code (Metric): 1608; Min Operating Temperature: -55°C; Max Operating Temperature: 155°C; Features: Automotive AEC-Q200; Tolerance: 5%; Packaging: Tape and Reel; Resistor Type: Thick Film; Number of Terminations: 2; Length: 0.063inch; Height: 0.018inch; Width: 0.031inch; ComponentLink1URL: https://industrial.panasonic.com/cdbs/www-data/pdf/RDO0000/AOA0000C331.pdf?src-supplier=Digi-Key; ComponentLink1Description: https://industrial.panasonic.com/cdbs/www-data/pdf/RDO0000/AOA0000C331.pdf?src-supplier=Digi-Key; Supplier Part Number 1: P150KBZCT-ND
RF6 = RK73B1ETTP100J: RES 10 OHM 5% 1/10W 0402; Manufacturer: KOA Speer; Power Rating: 63mW; Voltage Rating: 50V; Temperature Coefficient: 200ppm/°C; Supplier 1: Digi-Key; Manufacturer Part Number: RK73B1ETTP100J; RoHS: Yes; Category: Chip SMD Resistors; Stock 1: 424333; Pricing 1: 1=0.10000, 10=0.01500, 100=0.00590, 1000=0.00265, 2500=0.00230, 5000=0.00190 (USD); Mount: Surface Mount; Case/Package: 0402; Case Code (Imperial): 0402; Case Code (Metric): 1005; Min Operating Temperature: -55°C; Max Operating Temperature: 155°C; Tolerance: 5%; Packaging: Tape and Reel; Resistance: 10R; Package Quantity: 10000; Termination: SMD/SMT; Resistor Type: Thick Film; Voltage Rating (DC): 50V; Length: 1mm; Height: 0.35mm; Width: 0.5mm; Depth: 0.5mm; Military Standard: Not; Lead Free: Lead Free; ComponentLink1URL: https://datasheet.ciiva.com/27054/1876725-27054392.pdf?src-supplier=Jameco; ComponentLink1Description: https://datasheet.ciiva.com/27054/1876725-27054392.pdf?src-supplier=Jameco; ComponentLink2URL: https://datasheet.ciiva.com/5554/rk73b-5554335.pdf?src-supplier=Mouser; ComponentLink2Description: https://datasheet.ciiva.com/5554/rk73b-5554335.pdf?src-supplier=Mouser; Supplier Part Number 1: 2019-RK73B1ETTP100JCT-ND
RF7 = RT0402DRE072KL: RES SMD 2K OHM 0.5% 1/16W 0402; Manufacturer: Yageo; Resistance: 2kR; Voltage Rating (DC): 50V; Max Power Dissipation: 63mW; Temperature Coefficient: 50ppm/°C; Supplier 1: Digi-Key; Manufacturer Part Number: RT0402DRE072KL; RoHS: Yes; Category: Chip SMD Resistors; Stock 1: 1261; Pricing 1: 1=0.17000, 10=0.14600, 100=0.05690, 1000=0.02383, 2500=0.02185, 5000=0.01986 (USD); Case/Package: 0402; Case Code (Metric): 1005; Case Code (Imperial): 0402; Min Operating Temperature: -55°C; Max Operating Temperature: 155°C; Packaging: Tape and Reel; Resistor Type: Thin Film; Number of Terminations: 2; Features: Moisture Resistant; Tolerance: 0.5%; Length: 0.039inch; Height: 0.014inch; Width: 0.02inch; Lead Free: Lead Free; ComponentLink1URL: http://www.yageo.com/documents/recent/PYu-RT_1-to-0.01_RoHS_L_9.pdf?src-supplier=Digi-Key; ComponentLink1Description: http://www.yageo.com/documents/recent/PYu-RT_1-to-0.01_RoHS_L_9.pdf?src-supplier=Digi-Key; Supplier Part Number 1: 311-2269-1-ND
RF8 = CRCW0402200RJNED: RES SMD 200 OHM 5% 1/16W 0402; Manufacturer: Vishay Dale; Power Rating: 63mW; Temperature Coefficient: 200ppm/°C; Voltage Rating: 50V; Supplier 1: Digi-Key; Manufacturer Part Number: CRCW0402200RJNED; RoHS: Yes; Category: Chip SMD Resistors; Stock 1: 9583; Pricing 1: 1=0.10000, 10=0.02800, 100=0.01140, 1000=0.00511, 2500=0.00444, 5000=0.00367 (USD); Case/Package: 0402; Number of Pins: 2; Weight: 2.3E-05oz; Case Code (Imperial): 0402; Case Code (Metric): 1005; Contact Plating: Tin; Min Operating Temperature: -55°C; Max Operating Temperature: 155°C; Packaging: Tape and Reel; Resistance: 200R; Tolerance: 5%; Package Quantity: 1; Termination: SMD/SMT; Resistor Type: Thick Film; Number of Terminations: 2; Max Power Dissipation: 63mW; Features: Automotive AEC-Q200; Voltage Rating (DC): 50V; Length: 1mm; Height: 0.35mm; Width: 0.5mm; Depth: 0.5mm; Radiation Hardening: No; Lead Free: Lead Free; REACH SVHC: Unknown; Military Standard: Not; ComponentLink1URL: https://datasheet.ciiva.com/3883/41394838s8306212n6892-3883398.pdf?src-supplier=Arrow+Electronics; ComponentLink1Description: https://datasheet.ciiva.com/3883/41394838s8306212n6892-3883398.pdf?src-supplier=Arrow+Electronics; ComponentLink2URL: https://datasheet.ciiva.com/26914/getdatasheetpartid-123864-26914679.pdf?src-supplier=Verical; ComponentLink2Description: https://datasheet.ciiva.com/26914/getdatasheetpartid-123864-26914679.pdf?src-supplier=Verical; ComponentLink3URL: https://datasheet.ciiva.com/16759/70201119-16759061.pdf?src-supplier=Allied+Electronics; ComponentLink3Description: https://datasheet.ciiva.com/16759/70201119-16759061.pdf?src-supplier=Allied+Electronics; ComponentLink4URL: https://datasheet.ciiva.com/28634/1847332-28634488.pdf?src-supplier=Element14; ComponentLink4Description: https://datasheet.ciiva.com/28634/1847332-28634488.pdf?src-supplier=Element14; ComponentLink5URL: https://datasheet.ciiva.com/2462/dcrcwe3-2462073.pdf?src-supplier=Digi-Key; ComponentLink5Description: https://datasheet.ciiva.com/2462/dcrcwe3-2462073.pdf?src-supplier=Digi-Key; ComponentLink6URL: https://datasheet.ciiva.com/8336/dcrcwe3-8336649.pdf?src-supplier=Avnet; ComponentLink6Description: https://datasheet.ciiva.com/8336/dcrcwe3-8336649.pdf?src-supplier=Avnet; ComponentLink7URL: https://datasheet.ciiva.com/16394/dcrcwe3-16394457.pdf?src-supplier=Future+Electronics; ComponentLink7Description: https://datasheet.ciiva.com/16394/dcrcwe3-16394457.pdf?src-supplier=Future+Electronics; ComponentLink8URL: https://datasheet.ciiva.com/2462/dcrcwe3-2462074.pdf?src-supplier=Digi-Key; ComponentLink8Description: https://datasheet.ciiva.com/2462/dcrcwe3-2462074.pdf?src-supplier=Digi-Key; ComponentLink9URL: https://datasheet.ciiva.com/2462/dcrcwe3-2462075.pdf?src-supplier=Digi-Key; ComponentLink9Description: https://datasheet.ciiva.com/2462/dcrcwe3-2462075.pdf?src-supplier=Digi-Key; ComponentLink10URL: https://datasheet.ciiva.com/46385/1807946-46385293.pdf?src-supplier=Element14; ComponentLink10Description: https://datasheet.ciiva.com/46385/1807946-46385293.pdf?src-supplier=Element14; ComponentLink11URL: https://datasheet.ciiva.com/22869/70201119-22869423.pdf?src-supplier=Allied+Electronics; ComponentLink11Description: https://datasheet.ciiva.com/22869/70201119-22869423.pdf?src-supplier=Allied+Electronics; Supplier Part Number 1: 541-200JCT-ND
RF10 = ERJ-1TRQFR62U: RES 0.62 OHM 1% 1W 2512; Manufacturer: Panasonic; Temperature Coefficient: 200ppm/°C; Resistance: 620mR; Voltage Rating (DC): 200V; Supplier 1: Digi-Key; Manufacturer Part Number: ERJ-1TRQFR62U; RoHS: Yes; Category: Chip SMD Resistors; Stock 1: 12554; Pricing 1: 1=0.56000, 10=0.46400, 25=0.39800, 50=0.35820, 100=0.31180, 250=0.27868, 500=0.22560, 1000=0.18246 (USD); Mount: Surface Mount; Case/Package: 2512; Number of Pins: 2; Contact Plating: Tin; Case Code (Metric): 6432; Case Code (Imperial): 2512; Min Operating Temperature: -55°C; Max Operating Temperature: 125°C; Resistor Type: Thick Film,Low-Ohm-Resistor; Power Rating: 1W; Tolerance: 1%; Package Quantity: 1; Max Power Dissipation: 1W; Features: Automotive AEC-Q200; Number of Terminations: 2; Termination: SMD/SMT; Packaging: Tape and Reel; Voltage Rating: 200V; Length: 6.4mm; Height: 0.6mm; Depth: 3.2mm; Width: 0.126inch; Radiation Hardening: No; Lead Free: Lead Free; Military Standard: Not; REACH SVHC: No SVHC; ComponentLink1URL: https://datasheet.ciiva.com/11809/0900766b80eefa12-11809781.pdf?src-supplier=RSComponents; ComponentLink1Description: https://datasheet.ciiva.com/11809/0900766b80eefa12-11809781.pdf?src-supplier=RSComponents; ComponentLink2URL: https://datasheet.ciiva.com/46377/652411-46377610.pdf?src-supplier=Element14; ComponentLink2Description: https://datasheet.ciiva.com/46377/652411-46377610.pdf?src-supplier=Element14; ComponentLink3URL: https://datasheet.ciiva.com/6028/652411-6028428.pdf?src-supplier=Farnell; ComponentLink3Description: https://datasheet.ciiva.com/6028/652411-6028428.pdf?src-supplier=Farnell; ComponentLink4URL: https://datasheet.ciiva.com/9118/aoa0000ce3-9118749.pdf?src-supplier=Avnet; ComponentLink4Description: https://datasheet.ciiva.com/9118/aoa0000ce3-9118749.pdf?src-supplier=Avnet; ComponentLink5URL: https://datasheet.ciiva.com/48537/erj-eng-tds-48537741.pdf?src-supplier=Distrelec; ComponentLink5Description: https://datasheet.ciiva.com/48537/erj-eng-tds-48537741.pdf?src-supplier=Distrelec; ComponentLink6URL: https://datasheet.ciiva.com/46389/652411-46389615.pdf?src-supplier=Element14; ComponentLink6Description: https://datasheet.ciiva.com/46389/652411-46389615.pdf?src-supplier=Element14; ComponentLink7URL: https://datasheet.ciiva.com/24033/aoa0000ce3-72189-24033590.pdf?src-supplier=Mouser; ComponentLink7Description: https://datasheet.ciiva.com/24033/aoa0000ce3-72189-24033590.pdf?src-supplier=Mouser; ComponentLink8URL: https://datasheet.ciiva.com/30164/6aoa0000ce3-30164950.pdf?src-supplier=Onlinecomponents.com; ComponentLink8Description: https://datasheet.ciiva.com/30164/6aoa0000ce3-30164950.pdf?src-supplier=Onlinecomponents.com; ComponentLink9URL: https://datasheet.ciiva.com/17204/aoa0000ce3-17204952.pdf?src-supplier=Avnet+Europe; ComponentLink9Description: https://datasheet.ciiva.com/17204/aoa0000ce3-17204952.pdf?src-supplier=Avnet+Europe; ComponentLink10URL: https://datasheet.ciiva.com/48538/erj-eng-tds-48538571.pdf?src-supplier=Distrelec; ComponentLink10Description: https://datasheet.ciiva.com/48538/erj-eng-tds-48538571.pdf?src-supplier=Distrelec; Supplier Part Number 1: PT.62YCT-ND
RF11 = RMCF0402JT68R0: RES SMD 68 OHM 5% 1/16W 0402; Manufacturer: Stackpole Electronics; Max Power Dissipation: 63mW; Temperature Coefficient: 100ppm/°C; Supplier 1: Digi-Key; Manufacturer Part Number: RMCF0402JT68R0; RoHS: Yes; Category: Chip SMD Resistors; Stock 1: 124520; Pricing 1: 1=0.10000, 10=0.01000, 100=0.00410, 1000=0.00186, 2500=0.00161, 5000=0.00133 (USD); Mount: Surface Mount; Case/Package: 0402; Contact Plating: Tin,Matte; Case Code (Metric): 1005; Case Code (Imperial): 0402; Min Operating Temperature: -55°C; Max Operating Temperature: 155°C; Features: Automotive AEC-Q200; Resistor Type: Thick Film; Number of Terminations: 2; Resistance: 68R; Power Rating: 63mW; Tolerance: 5%; Packaging: Tape and Reel; Length: 0.039inch; Height: 0.016inch; Width: 0.02inch; Radiation Hardening: No; Lead Free: Lead Free; ComponentLink1URL: https://www.seielect.com/Catalog/SEI-RMCF_RMCP.pdf?src-supplier=Digi-Key; ComponentLink1Description: https://www.seielect.com/Catalog/SEI-RMCF_RMCP.pdf?src-supplier=Digi-Key; ComponentLink2URL: https://www.seielect.com/catalog/SEI-Packaging.pdf?src-supplier=Digi-Key; ComponentLink2Description: https://www.seielect.com/catalog/SEI-Packaging.pdf?src-supplier=Digi-Key; ComponentLink3URL: https://www.seielect.com/catalog/SEI-RMCF_RMCP.pdf?src-supplier=Avnet; ComponentLink3Description: https://www.seielect.com/catalog/SEI-RMCF_RMCP.pdf?src-supplier=Avnet; ComponentLink4URL: http://www.seielect.com/Catalog/Sei-RMC.pdf?src-supplier=Future+Electronics; ComponentLink4Description: http://www.seielect.com/Catalog/Sei-RMC.pdf?src-supplier=Future+Electronics; Supplier Part Number 1: RMCF0402JT68R0CT-ND
RF12 = CRGH2512J18R: RES SMD 18 OHM 5% 2W 2512; Manufacturer: TE Connectivity; Temperature Coefficient: 100ppm/°C; Voltage Rating (DC): 200V; Voltage Rating: 250V; Number of Resistors: 1; Supplier 1: Digi-Key; Manufacturer Part Number: CRGH2512J18R; RoHS: Yes; Category: Chip SMD Resistors; Stock 1: 5441; Pricing 1: 1=0.56000, 10=0.43100, 100=0.18100, 1000=0.09984 (USD); Mount: Surface Mount; Case/Package: 2512; Weight: 0.001429oz; Case Code (Imperial): 2512; Case Code (Metric): 6432; Min Operating Temperature: -55°C; Max Operating Temperature: 125°C; Resistance: 18R; Power Rating: 2W; Tolerance: 5%; Packaging: Tape and Reel; Resistor Type: Thick Film,Power resistor; Number of Terminations: 2; Termination: Solder; Package Quantity: 4000; Length: 6.35mm; Height: 0.55mm; Depth: 3.2mm; Width: 3.2mm; REACH SVHC: No SVHC; ELV: Compliant; ComponentLink1URL: https://datasheet.ciiva.com/31407/1755795-31407831.pdf?src-supplier=Farnell; ComponentLink1Description: https://datasheet.ciiva.com/31407/1755795-31407831.pdf?src-supplier=Farnell; Supplier Part Number 1: A126456CT-ND
TR1 = 750311558: FLYBACK TRANSFORMER WE-FB; Manufacturer: Wurth Electronics Midcom; Frequency: 300kHz; Supplier 1: Digi-Key; Manufacturer Part Number: 750311558; RoHS: Yes; Category: Transformers; Stock 1: 478; Pricing 1: 1=6.21000, 10=6.13300, 50=5.74900, 100=5.17400 (USD); Mount: Surface Mount; Min Operating Temperature: -40°C; Max Operating Temperature: 125°C; Packaging: Tape and Reel; Package Quantity: 300; Length: 9.78mm; Height - Seated (Max): 10.54mm; Width: 9.14mm; ComponentLink1URL: https://datasheet.ciiva.com/18573/750311558-18573660.pdf?src-supplier=Digi-Key; ComponentLink1Description: https://datasheet.ciiva.com/18573/750311558-18573660.pdf?src-supplier=Digi-Key; Supplier Part Number 1: 1297-1004-1-ND